# Altium project UsMimoTestBench_MainBoard.PrjPcb (part 1 of 2)
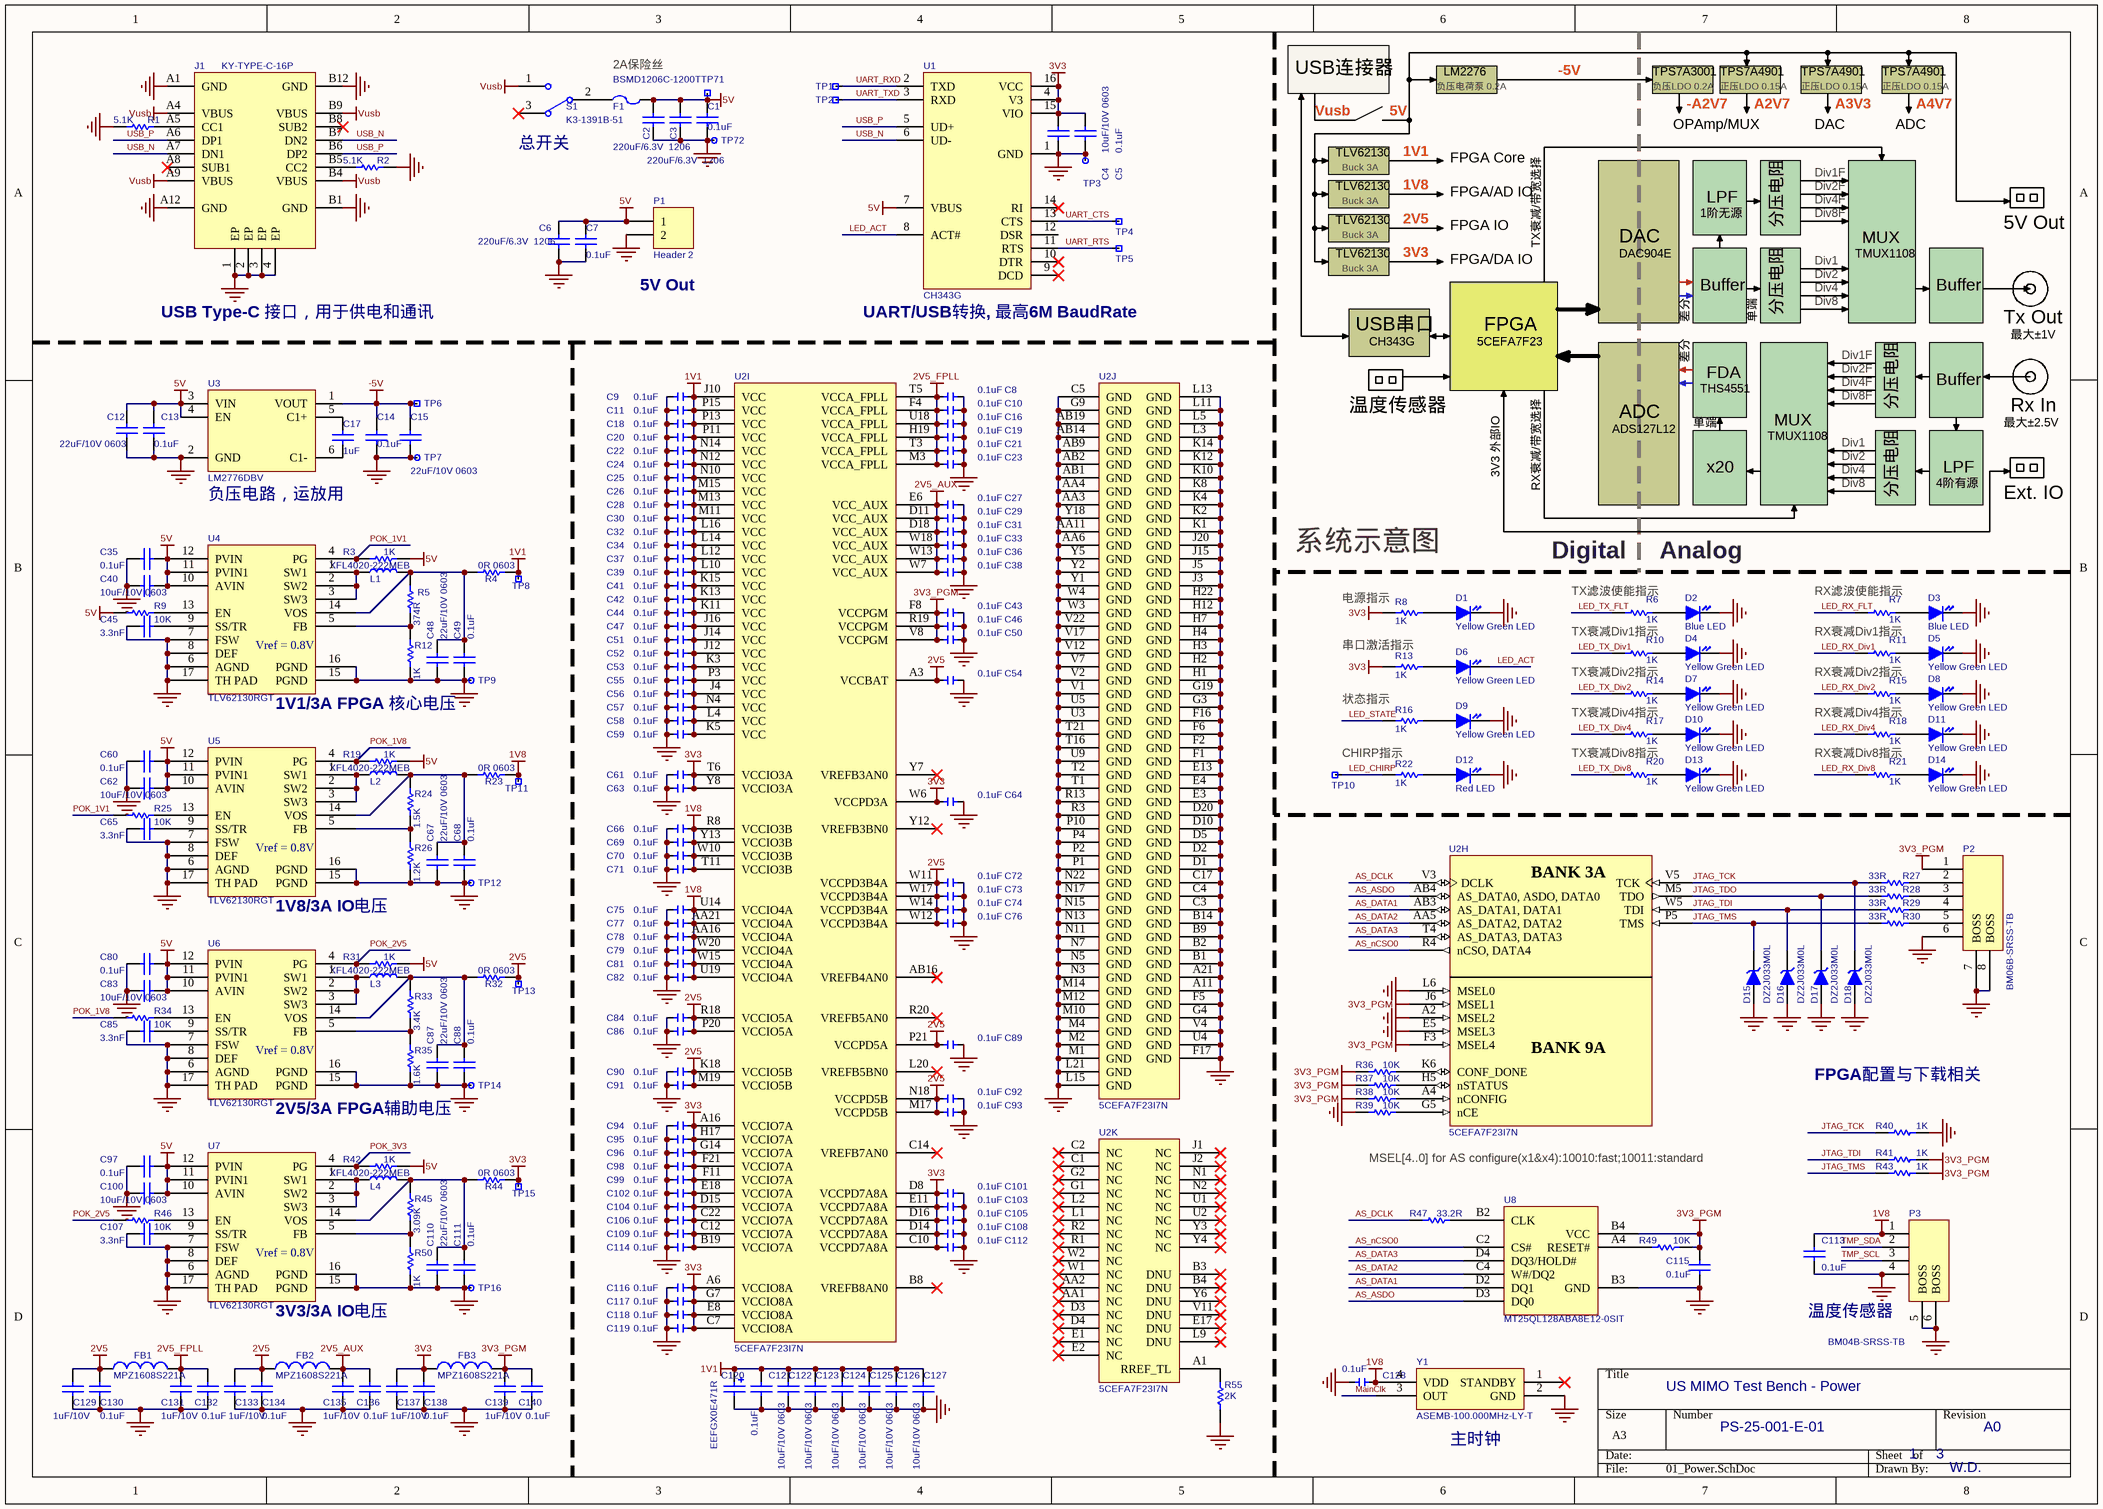
[diagram p0: 01_Power.SchDoc]
3 sheets, 526 parts. Net scope: global (net labels, ports and power ports of the same name join across sheets).
Board file: PS-25-001-E-01.PcbDoc
Sheets:
  01_Power.SchDoc
  02_Analog.SchDoc
  03_IO.SchDoc

## Sheet 01_Power.SchDoc
size A3

### Parts
C1  0.1uF  [1005[0402]CAP]
C2  220uF/6.3V  1206  [1206CAP]
C3  220uF/6.3V  1206  [1206CAP]
C4  10uF/10V 0603  [1608[0603]CAP]
C5  0.1uF  [1005[0402]CAP]
C6  220uF/6.3V  1206  [1206CAP]
C7  0.1uF  [1005[0402]CAP]
C8  0.1uF  [1005[0402]CAP]
C9  0.1uF  [1005[0402]CAP]
C10  0.1uF  [1005[0402]CAP]
C11  0.1uF  [1005[0402]CAP]
C12  22uF/10V 0603  [1608[0603]CAP]
C13  0.1uF  [1005[0402]CAP]
C14  0.1uF  [1005[0402]CAP]
C15  22uF/10V 0603  [1608[0603]CAP]
C16  0.1uF  [1005[0402]CAP]
C17  1uF  [1005[0402]CAP]
C18  0.1uF  [1005[0402]CAP]
C19  0.1uF  [1005[0402]CAP]
C20  0.1uF  [1005[0402]CAP]
C21  0.1uF  [1005[0402]CAP]
C22  0.1uF  [1005[0402]CAP]
C23  0.1uF  [1005[0402]CAP]
C24  0.1uF  [1005[0402]CAP]
C25  0.1uF  [1005[0402]CAP]
C26  0.1uF  [1005[0402]CAP]
C27  0.1uF  [1005[0402]CAP]
C28  0.1uF  [1005[0402]CAP]
C29  0.1uF  [1005[0402]CAP]
C30  0.1uF  [1005[0402]CAP]
C31  0.1uF  [1005[0402]CAP]
C32  0.1uF  [1005[0402]CAP]
C33  0.1uF  [1005[0402]CAP]
C34  0.1uF  [1005[0402]CAP]
C35  0.1uF  [1005[0402]CAP]
C36  0.1uF  [1005[0402]CAP]
C37  0.1uF  [1005[0402]CAP]
C38  0.1uF  [1005[0402]CAP]
C39  0.1uF  [1005[0402]CAP]
C40  10uF/10V 0603  [1608[0603]CAP]
C41  0.1uF  [1005[0402]CAP]
C42  0.1uF  [1005[0402]CAP]
C43  0.1uF  [1005[0402]CAP]
C44  0.1uF  [1005[0402]CAP]
C45  3.3nF  [1005[0402]CAP]
C46  0.1uF  [1005[0402]CAP]
C47  0.1uF  [1005[0402]CAP]
C48  22uF/10V 0603  [1608[0603]CAP]
C49  0.1uF  [1005[0402]CAP]
C50  0.1uF  [1005[0402]CAP]
C51  0.1uF  [1005[0402]CAP]
C52  0.1uF  [1005[0402]CAP]
C53  0.1uF  [1005[0402]CAP]
C54  0.1uF  [1005[0402]CAP]
C55  0.1uF  [1005[0402]CAP]
C56  0.1uF  [1005[0402]CAP]
C57  0.1uF  [1005[0402]CAP]
C58  0.1uF  [1005[0402]CAP]
C59  0.1uF  [1005[0402]CAP]
C60  0.1uF  [1005[0402]CAP]
C61  0.1uF  [1005[0402]CAP]
C62  10uF/10V 0603  [1608[0603]CAP]
C63  0.1uF  [1005[0402]CAP]
C64  0.1uF  [1005[0402]CAP]
C65  3.3nF  [1005[0402]CAP]
C66  0.1uF  [1005[0402]CAP]
C67  22uF/10V 0603  [1608[0603]CAP]
C68  0.1uF  [1005[0402]CAP]
C69  0.1uF  [1005[0402]CAP]
C70  0.1uF  [1005[0402]CAP]
C71  0.1uF  [1005[0402]CAP]
C72  0.1uF  [1005[0402]CAP]
C73  0.1uF  [1005[0402]CAP]
C74  0.1uF  [1005[0402]CAP]
C75  0.1uF  [1005[0402]CAP]
C76  0.1uF  [1005[0402]CAP]
C77  0.1uF  [1005[0402]CAP]
C78  0.1uF  [1005[0402]CAP]
C79  0.1uF  [1005[0402]CAP]
C80  0.1uF  [1005[0402]CAP]
C81  0.1uF  [1005[0402]CAP]
C82  0.1uF  [1005[0402]CAP]
C83  10uF/10V 0603  [1608[0603]CAP]
C84  0.1uF  [1005[0402]CAP]
C85  3.3nF  [1005[0402]CAP]
C86  0.1uF  [1005[0402]CAP]
C87  22uF/10V 0603  [1608[0603]CAP]
C88  0.1uF  [1005[0402]CAP]
C89  0.1uF  [1005[0402]CAP]
C90  0.1uF  [1005[0402]CAP]
C91  0.1uF  [1005[0402]CAP]
C92  0.1uF  [1005[0402]CAP]
C93  0.1uF  [1005[0402]CAP]
C94  0.1uF  [1005[0402]CAP]
C95  0.1uF  [1005[0402]CAP]
C96  0.1uF  [1005[0402]CAP]
C97  0.1uF  [1005[0402]CAP]
C98  0.1uF  [1005[0402]CAP]
C99  0.1uF  [1005[0402]CAP]
C100  10uF/10V 0603  [1608[0603]CAP]
C101  0.1uF  [1005[0402]CAP]
C102  0.1uF  [1005[0402]CAP]
C103  0.1uF  [1005[0402]CAP]
C104  0.1uF  [1005[0402]CAP]
C105  0.1uF  [1005[0402]CAP]
C106  0.1uF  [1005[0402]CAP]
C107  3.3nF  [1005[0402]CAP]
C108  0.1uF  [1005[0402]CAP]
C109  0.1uF  [1005[0402]CAP]
C110  22uF/10V 0603  [1608[0603]CAP]
C111  0.1uF  [1005[0402]CAP]
C112  0.1uF  [1005[0402]CAP]
C113  0.1uF  [1005[0402]CAP]
C114  0.1uF  [1005[0402]CAP]
C115  0.1uF  [1005[0402]CAP]
C116  0.1uF  [1005[0402]CAP]
C117  0.1uF  [1005[0402]CAP]
C118  0.1uF  [1005[0402]CAP]
C119  0.1uF  [1005[0402]CAP]
C120  EEFGX0E471R  [TE]
C121  0.1uF  [1005[0402]CAP]
C122  10uF/10V 0603  [1608[0603]CAP]
C123  10uF/10V 0603  [1608[0603]CAP]
C124  10uF/10V 0603  [1608[0603]CAP]
C125  10uF/10V 0603  [1608[0603]CAP]
C126  10uF/10V 0603  [1608[0603]CAP]
C127  10uF/10V 0603  [1608[0603]CAP]
C128  0.1uF  [1005[0402]CAP]
C129  1uF/10V  [1005[0402]CAP]
C130  0.1uF  [1005[0402]CAP]
C131  1uF/10V  [1005[0402]CAP]
C132  0.1uF  [1005[0402]CAP]
C133  1uF/10V  [1005[0402]CAP]
C134  0.1uF  [1005[0402]CAP]
C135  1uF/10V  [1005[0402]CAP]
C136  0.1uF  [1005[0402]CAP]
C137  1uF/10V  [1005[0402]CAP]
C138  0.1uF  [1005[0402]CAP]
C139  1uF/10V  [1005[0402]CAP]
C140  0.1uF  [1005[0402]CAP]
D1  Yellow Green LED  [1608[0603]LED]
D2  Blue LED  [1608[0603]LED]
D3  Blue LED  [1608[0603]LED]
D4  Yellow Green LED  [1608[0603]LED]
D5  Yellow Green LED  [1608[0603]LED]
D6  Yellow Green LED  [1608[0603]LED]
D7  Yellow Green LED  [1608[0603]LED]
D8  Yellow Green LED  [1608[0603]LED]
D9  Yellow Green LED  [1608[0603]LED]
D10  Yellow Green LED  [1608[0603]LED]
D11  Yellow Green LED  [1608[0603]LED]
D12  Red LED  [1608[0603]LED]
D13  Yellow Green LED  [1608[0603]LED]
D14  Yellow Green LED  [1608[0603]LED]
D15  DZ2J033M0L  [SC-90A]
D16  DZ2J033M0L  [SC-90A]
D17  DZ2J033M0L  [SC-90A]
D18  DZ2J033M0L  [SC-90A]
F1  BSMD1206C-1200T  [1206]
FB1  MPZ1608S221A  [1608[0603]FB]
FB2  MPZ1608S221A  [1608[0603]FB]
FB3  MPZ1608S221A  [1608[0603]FB]
J1  KY-TYPE-C-16P  [USBTypeC]
L1  XFL4020-222MEB  [XFL4020]
L2  XFL4020-222MEB  [XFL4020]
L3  XFL4020-222MEB  [XFL4020]
L4  XFL4020-222MEB  [XFL4020]
P1  Header 2  [KEF2510_2P]
P2  BM06B-SRSS-TB  [SM06B-SRSS-TB]
P3  BM04B-SRSS-TB  [BM04B-SRSS-TB]
R1  5.1K  [1005[0402]RES]
R2  5.1K  [1005[0402]RES]
R3  1K  [1005[0402]RES]
R4  0R 0603  [1608[0603]RES]
R5  374R  [1005[0402]RES]
R6  1K  [1005[0402]RES]
R7  1K  [1005[0402]RES]
R8  1K  [1005[0402]RES]
R9  10K  [1005[0402]RES]
R10  1K  [1005[0402]RES]
R11  1K  [1005[0402]RES]
R12  1K  [1005[0402]RES]
R13  1K  [1005[0402]RES]
R14  1K  [1005[0402]RES]
R15  1K  [1005[0402]RES]
R16  1K  [1005[0402]RES]
R17  1K  [1005[0402]RES]
R18  1K  [1005[0402]RES]
R19  1K  [1005[0402]RES]
R20  1K  [1005[0402]RES]
R21  1K  [1005[0402]RES]
R22  1K  [1005[0402]RES]
R23  0R 0603  [1608[0603]RES]
R24  1.5K  [1005[0402]RES]
R25  10K  [1005[0402]RES]
R26  1.2K  [1005[0402]RES]
R27  33R  [1005[0402]RES]
R28  33R  [1005[0402]RES]
R29  33R  [1005[0402]RES]
R30  33R  [1005[0402]RES]
R31  1K  [1005[0402]RES]
R32  0R 0603  [1608[0603]RES]
R33  3.4K  [1005[0402]RES]
R34  10K  [1005[0402]RES]
R35  1.6K  [1005[0402]RES]
R36  10K  [1005[0402]RES]
R37  10K  [1005[0402]RES]
R38  10K  [1005[0402]RES]
R39  10K  [1005[0402]RES]
R40  1K  [1005[0402]RES]
R41  1K  [1005[0402]RES]
R42  1K  [1005[0402]RES]
R43  1K  [1005[0402]RES]
R44  0R 0603  [1608[0603]RES]
R45  3.09K  [1005[0402]RES]
R46  10K  [1005[0402]RES]
R47  33.2R  [1005[0402]RES]
R49  10K  [1005[0402]RES]
R50  1K  [1005[0402]RES]
R55  2K  [1005[0402]RES]
S1  K3-1391B-51  [SWITCH_K3-1391B-51]
TP1  TP_P  [tpad_020_REC]  (value not drawn)
TP2  TP_P  [tpad_020_REC]  (value not drawn)
TP3  TP_N  [tpad_020]  (value not drawn)
TP4  TP_P  [tpad_020_REC]  (value not drawn)
TP5  TP_P  [tpad_020_REC]  (value not drawn)
TP6  TP_P  [tpad_020_REC]  (value not drawn)
TP7  TP_N  [tpad_020]  (value not drawn)
TP8  TP_P  [tpad_020_REC]  (value not drawn)
TP9  TP_N  [tpad_020]  (value not drawn)
TP10  TP_P  [tpad_020_REC]  (value not drawn)
TP11  TP_P  [tpad_020_REC]  (value not drawn)
TP12  TP_N  [tpad_020]  (value not drawn)
TP13  TP_P  [tpad_020_REC]  (value not drawn)
TP14  TP_N  [tpad_020]  (value not drawn)
TP15  TP_P  [tpad_020_REC]  (value not drawn)
TP16  TP_N  [tpad_020]  (value not drawn)
TP71  TP_P  [tpad_020_REC]  (value not drawn)
TP72  TP_N  [tpad_020]  (value not drawn)
U1  CH343G  [SO-16]
U2  5CEFA7F23I7N  [FBGA484]  (parts H,I,J,K of 11)
U3  LM2776DBV  [SOT23-6]
U4  TLV62130RGT  [S-PVQFN-N16]
U5  TLV62130RGT  [S-PVQFN-N16]
U6  TLV62130RGT  [S-PVQFN-N16]
U7  TLV62130RGT  [S-PVQFN-N16]
U8  MT25QL128ABA8E12-0SIT  [T-PBGA_5X5]
Y1  ASEMB-100.000MHz-LY-T  [XTAL_3.2X2.5]

### Nets
1V1: C9.2 C11.2 C18.2 C20.2 C22.2 C24.2 C25.2 C26.2 C28.2 C30.2 C32.2 C34.2 C37.2 C39.2 C41.2 C42.2 C44.2 C47.2 C51.2 C52.2 C53.2 C55.2 C56.2 C57.2 C58.2 C59.2 C120.1 C121.2 C122.1 C123.1 C124.1 C125.1 C126.1 C127.1 R4.1 TP8.1(A2) U2.J4(VCC) U2.J10(VCC) U2.J12(VCC) U2.J14(VCC) U2.J16(VCC) U2.K3(VCC) U2.K5(VCC) U2.K11(VCC) U2.K13(VCC) U2.K15(VCC) U2.L4(VCC) U2.L10(VCC) U2.L12(VCC) U2.L14(VCC) U2.L16(VCC) U2.M11(VCC) U2.M13(VCC) U2.M15(VCC) U2.N4(VCC) U2.N10(VCC) U2.N12(VCC) U2.N14(VCC) U2.P3(VCC) U2.P11(VCC) U2.P13(VCC) U2.P15(VCC)
1V8: C66.2 C69.2 C70.2 C71.2 C75.2 C77.2 C78.2 C79.2 C81.2 C82.2 C113.2 C128.1 P3.1 R23.1 TP11.1(A2) U2.AA16(VCCIO4A) U2.AA21(VCCIO4A) U2.R8(VCCIO3B) U2.T11(VCCIO3B) U2.U14(VCCIO4A) U2.U19(VCCIO4A) U2.W10(VCCIO3B) U2.W15(VCCIO4A) U2.W20(VCCIO4A) U2.Y13(VCCIO3B) Y1.4(VDD)
2V5: C54.2 C72.2 C73.2 C74.2 C76.2 C84.2 C86.2 C89.2 C90.2 C91.2 C92.2 C93.2 C129.1 C130.2 C133.1 C134.2 FB1.1 FB2.1 R32.1 TP13.1(A2) U2.A3(VCCBAT) U2.K18(VCCIO5B) U2.M17(VCCPD5B) U2.M19(VCCIO5B) U2.N18(VCCPD5B) U2.P20(VCCIO5A) U2.P21(VCCPD5A) U2.R18(VCCIO5A) U2.W11(VCCPD3B4A) U2.W12(VCCPD3B4A) U2.W14(VCCPD3B4A) U2.W17(VCCPD3B4A)
2V5_AUX: C27.2 C29.2 C31.2 C33.2 C36.2 C38.2 C135.1 C136.2 FB2.2 U2.D11(VCC_AUX) U2.D18(VCC_AUX) U2.E6(VCC_AUX) U2.W7(VCC_AUX) U2.W13(VCC_AUX) U2.W18(VCC_AUX)
2V5_FPLL: C8.2 C10.2 C16.2 C19.2 C21.2 C23.2 C131.1 C132.2 FB1.2 U2.F4(VCCA_FPLL) U2.H19(VCCA_FPLL) U2.M3(VCCA_FPLL) U2.T3(VCCA_FPLL) U2.T5(VCCA_FPLL) U2.U18(VCCA_FPLL)
3V3: C4.1 C5.2 C61.2 C63.2 C64.2 C94.2 C95.2 C96.2 C98.2 C99.2 C101.2 C102.2 C103.2 C104.2 C105.2 C106.2 C108.2 C109.2 C112.2 C114.2 C116.2 C117.2 C118.2 C119.2 C137.1 C138.2 FB3.1 R8.2 R13.2 R44.1 TP15.1(A2) U1.4(V3) U1.15(VIO) U1.16(VCC) U2.A6(VCCIO8A) U2.A16(VCCIO7A) U2.B19(VCCIO7A) U2.C7(VCCIO8A) U2.C10(VCCPD7A8A) U2.C12(VCCIO7A) U2.C22(VCCIO7A) U2.D8(VCCPD7A8A) U2.D14(VCCPD7A8A) U2.D15(VCCIO7A) U2.D16(VCCPD7A8A) U2.E8(VCCIO8A) U2.E11(VCCPD7A8A) U2.E18(VCCIO7A) U2.F11(VCCIO7A) U2.F21(VCCIO7A) U2.G7(VCCIO8A) U2.G14(VCCIO7A) U2.H17(VCCIO7A) U2.T6(VCCIO3A) U2.W6(VCCPD3A) U2.Y8(VCCIO3A)
3V3_PGM: C43.2 C46.2 C50.2 C115.2 C139.1 C140.2 FB3.2 P2.1 R36.2 R37.2 R38.2 R41.2 R43.2 R49.1 U2.F3(MSEL4) U2.F8(VCCPGM) U2.J6(MSEL1) U2.R19(VCCPGM) U2.V8(VCCPGM) U8.B4(VCC)
5V: C1.2 C2.2 C3.2 C6.2 C7.2 C12.1 C13.2 C35.1 C40.1 C60.1 C62.1 C80.1 C83.1 C97.1 C100.1 F1.2 P1.1 R3.1 R9.1 R19.1 R31.1 R42.1 TP71.1(A2) U1.7(VBUS) U3.3(VIN) U3.4(EN) U4.10(AVIN) U4.11(PVIN1) U4.12(PVIN) U5.10(AVIN) U5.11(PVIN1) U5.12(PVIN) U6.10(AVIN) U6.11(PVIN1) U6.12(PVIN) U7.10(AVIN) U7.11(PVIN1) U7.12(PVIN)
-5V: C14.2 C15.1 TP6.1(A2) U3.1(VOUT)
GND: C1.1 C2.1 C3.1 C4.2 C5.1 C6.1 C7.1 C8.1 C9.1 C10.1 C11.1 C12.2 C13.1 C14.1 C15.2 C16.1 C18.1 C19.1 C20.1 C21.1 C22.1 C23.1 C24.1 C25.1 C26.1 C27.1 C28.1 C29.1 C30.1 C31.1 C32.1 C33.1 C34.1 C35.2 C36.1 C37.1 C38.1 C39.1 C40.2 C41.1 C42.1 C43.1 C44.1 C45.2 C46.1 C47.1 C48.2 C49.1 C50.1 C51.1 C52.1 C53.1 C54.1 C55.1 C56.1 C57.1 C58.1 C59.1 C60.2 C61.1 C62.2 C63.1 C64.1 C65.2 C66.1 C67.2 C68.1 C69.1 C70.1 C71.1 C72.1 C73.1 C74.1 C75.1 C76.1 C77.1 C78.1 C79.1 C80.2 C81.1 C82.1 C83.2 C84.1 C85.2 C86.1 C87.2 C88.1 C89.1 C90.1 C91.1 C92.1 C93.1 C94.1 C95.1 C96.1 C97.2 C98.1 C99.1 C100.2 C101.1 C102.1 C103.1 C104.1 C105.1 C106.1 C107.2 C108.1 C109.1 C110.2 C111.1 C112.1 C113.1 C114.1 C115.1 C116.1 C117.1 C118.1 C119.1 C120.2 C121.1 C122.2 C123.2 C124.2 C125.2 C126.2 C127.2 C128.2 C129.2 C130.1 C131.2 C132.1 C133.2 C134.1 C135.2 C136.1 C137.2 C138.1 C139.2 C140.1 D1.2(K) D2.2(K) D3.2(K) D4.2(K) D5.2(K) D7.2(K) D8.2(K) D9.2(K) D10.2(K) D11.2(K) D12.2(K) D13.2(K) D14.2(K) D15.1(A) D16.1(A) D17.1(A) D18.1(A) J1.1(EP) J1.2(EP) J1.3(EP) J1.4(EP) J1.A1(GND) J1.A12(GND) J1.B1(GND) J1.B12(GND) P1.2 P2.6 P2.7(BOSS) P2.8(BOSS) P3.4 P3.5(BOSS) P3.6(BOSS) R1.2 R2.1 R12.1 R26.1 R35.1 R39.2 R40.2 R50.1 R55.1 TP3.1(A2) TP7.1(A2) TP9.1(A2) TP12.1(A2) TP14.1(A2) TP16.1(A2) TP72.1(A2) U1.1(GND) U2.A2(MSEL2) U2.A11(GND) U2.A21(GND) U2.AA3(GND) U2.AA4(GND) U2.AA6(GND) U2.AA11(GND) U2.AB1(GND) U2.AB2(GND) U2.AB9(GND) U2.AB14(GND) U2.AB19(GND) U2.B1(GND) U2.B2(GND) U2.B9(GND) U2.B14(GND) U2.C3(GND) U2.C4(GND) U2.C5(GND) U2.C17(GND) U2.D1(GND) U2.D2(GND) U2.D5(GND) U2.D10(GND) U2.D20(GND) U2.E3(GND) U2.E4(GND) U2.E5(MSEL3) U2.E13(GND) U2.F1(GND) U2.F2(GND) U2.F5(GND) U2.F6(GND) U2.F16(GND) U2.F17(GND) U2.G3(GND) U2.G4(GND) U2.G9(GND) U2.G19(GND) U2.H1(GND) U2.H2(GND) U2.H3(GND) U2.H4(GND) U2.H7(GND) U2.H12(GND) U2.H22(GND) U2.J3(GND) U2.J5(GND) U2.J15(GND) U2.J20(GND) U2.K1(GND) U2.K2(GND) U2.K4(GND) U2.K8(GND) U2.K10(GND) U2.K12(GND) U2.K14(GND) U2.L3(GND) U2.L5(GND) U2.L6(MSEL0) U2.L11(GND) U2.L13(GND) U2.L15(GND) U2.L21(GND) U2.M1(GND) U2.M2(GND) U2.M4(GND) U2.M10(GND) U2.M12(GND) U2.M14(GND) U2.N3(GND) U2.N5(GND) U2.N7(GND) U2.N11(GND) U2.N13(GND) U2.N15(GND) U2.N17(GND) U2.N22(GND) U2.P1(GND) U2.P2(GND) U2.P4(GND) U2.P10(GND) U2.R3(GND) U2.R13(GND) U2.T1(GND) U2.T2(GND) U2.T16(GND) U2.T21(GND) U2.U3(GND) U2.U4(GND) U2.U5(GND) U2.U9(GND) U2.V1(GND) U2.V2(GND) U2.V4(GND) U2.V7(GND) U2.V12(GND) U2.V17(GND) U2.V22(GND) U2.W3(GND) U2.W4(GND) U2.Y1(GND) U2.Y2(GND) U2.Y5(GND) U2.Y18(GND) U3.2(GND) U4.6(AGND) U4.7(FSW) U4.8(DEF) U4.15(PGND) U4.16(PGND) U4.17(TH_PAD) U5.6(AGND) U5.7(FSW) U5.8(DEF) U5.15(PGND) U5.16(PGND) U5.17(TH_PAD) U6.6(AGND) U6.7(FSW) U6.8(DEF) U6.15(PGND) U6.16(PGND) U6.17(TH_PAD) U7.6(AGND) U7.7(FSW) U7.8(DEF) U7.15(PGND) U7.16(PGND) U7.17(TH_PAD) U8.B3(GND) Y1.2(GND)
Vusb: J1.A4(VBUS) J1.A9(VBUS) J1.B4(VBUS) J1.B9(VBUS) S1.1
AS_ASDO: U2.AB4(AS_DATA0,_ASDO,_DATA0) U8.D3(DQ0)
AS_DATA1: U2.AB3(AS_DATA1,_DATA1) U8.D2(DQ1)
AS_DATA2: U2.AA5(AS_DATA2,_DATA2) U8.C4(W#/DQ2)
AS_DATA3: U2.T4(AS_DATA3,_DATA3) U8.D4(DQ3/HOLD#)
AS_DCLK: R47.1 U2.V3(DCLK)
AS_nCSO0: U2.R4(nCSO,_DATA4) U8.C2(CS#)
JTAG_TCK: D18.2(K) R27.2 R40.1 U2.V5(TCK)
JTAG_TDI: D16.2(K) R29.2 R41.1 U2.W5(TDI)
JTAG_TDO: D17.2(K) R28.2 U2.M5(TDO)
JTAG_TMS: D15.2(K) R30.2 R43.1 U2.P5(TMS)
LED_ACT: D6.2(K) U1.8(ACT#)
LED_CHIRP: R22.2 TP10.1(A2)
LED_RX_Div1: R11.2
LED_RX_Div2: R15.2
LED_RX_Div4: R18.2
LED_RX_Div8: R21.2
LED_RX_FLT: R7.2
LED_STATE: R16.2
LED_TX_Div1: R10.2
LED_TX_Div2: R14.2
LED_TX_Div4: R17.2
LED_TX_Div8: R20.2
LED_TX_FLT: R6.2
MainClk: Y1.3(OUT)
POK_1V1: R3.2 R25.1 U4.4(PG)
POK_1V8: R19.2 R34.1 U5.4(PG)
POK_2V5: R31.2 R46.1 U6.4(PG)
POK_3V3: R42.2 U7.4(PG)
TMP_SCL: P3.3
TMP_SDA: P3.2
UART_CTS: TP4.1(A2) U1.13(CTS)
UART_RTS: TP5.1(A2) U1.11(RTS)
UART_RXD: TP1.1(A2) U1.2(TXD)
UART_TXD: TP2.1(A2) U1.3(RXD)
USB_N: J1.A7(DN1) J1.B7(DN2) U1.6(UD-)
USB_P: J1.A6(DP1) J1.B6(DP2) U1.5(UD+)
NetC17_1: C17.1 U3.6(C1-)
NetC17_2: C17.2 U3.5(C1+)
NetC45_1: C45.1 U4.9(SS/TR)
NetC48_1: C48.1 C49.2 L1.2 R4.2 R5.2 U4.14(VOS)
NetC65_1: C65.1 U5.9(SS/TR)
NetC67_1: C67.1 C68.2 L2.2 R23.2 R24.2 U5.14(VOS)
NetC85_1: C85.1 U6.9(SS/TR)
NetC87_1: C87.1 C88.2 L3.2 R32.2 R33.2 U6.14(VOS)
NetC107_1: C107.1 U7.9(SS/TR)
NetC110_1: C110.1 C111.2 L4.2 R44.2 R45.2 U7.14(VOS)
NetD1_1: D1.1(A) R8.1
NetD2_1: D2.1(A) R6.1
NetD3_1: D3.1(A) R7.1
NetD4_1: D4.1(A) R10.1
NetD5_1: D5.1(A) R11.1
NetD6_1: D6.1(A) R13.1
NetD7_1: D7.1(A) R14.1
NetD8_1: D8.1(A) R15.1
NetD9_1: D9.1(A) R16.1
NetD10_1: D10.1(A) R17.1
NetD11_1: D11.1(A) R18.1
NetD12_1: D12.1(A) R22.1
NetD13_1: D13.1(A) R20.1
NetD14_1: D14.1(A) R21.1
NetF1_1: F1.1 S1.2
NetJ1_A5: J1.A5(CC1) R1.1
NetJ1_B5: J1.B5(CC2) R2.2
NetL1_1: L1.1 U4.1(SW1) U4.2(SW2) U4.3(SW3)
NetL2_1: L2.1 U5.1(SW1) U5.2(SW2) U5.3(SW3)
NetL3_1: L3.1 U6.1(SW1) U6.2(SW2) U6.3(SW3)
NetL4_1: L4.1 U7.1(SW1) U7.2(SW2) U7.3(SW3)
NetP2_2: P2.2 R27.1
NetP2_3: P2.3 R28.1
NetP2_4: P2.4 R29.1
NetP2_5: P2.5 R30.1
NetR5_1: R5.1 R12.2 U4.5(FB)
NetR9_2: R9.2 U4.13(EN)
NetR24_1: R24.1 R26.2 U5.5(FB)
NetR25_2: R25.2 U5.13(EN)
NetR33_1: R33.1 R35.2 U6.5(FB)
NetR34_2: R34.2 U6.13(EN)
NetR36_1: R36.1 U2.K6(CONF_DONE)
NetR37_1: R37.1 U2.H5(nSTATUS)
NetR38_1: R38.1 U2.A4(nCONFIG)
NetR39_1: R39.1 U2.G5(nCE)
NetR45_1: R45.1 R50.2 U7.5(FB)
NetR46_2: R46.2 U7.13(EN)
NetR47_2: R47.2 U8.B2(CLK)
NetR49_2: R49.2 U8.A4(RESET#)
NetR55_2: R55.2 U2.A1(RREF_TL)

Not connected (* = marked no-connect by the designer): J1 A8(SUB1)* B8(SUB2)*; S1 3*; U1 9(DCD)* 10(DTR)* 12(DSR) 14(RI)*; U2 AA1(NC)* AA2(NC)* AB16(VREFB4AN0)* B3(DNU)* B4(DNU)* B8(VREFB8AN0)* C1(NC)* C2(NC)* C14(VREFB7AN0)* D3(NC)* D4(NC)* E1(NC)* E2(NC)* E17(DNU)* G1(NC)* G2(NC)* J1(NC)* J2(NC)* L1(NC)* L2(NC)* L9(DNU)* L20(VREFB5BN0)* N1(NC)* N2(NC)* R1(NC)* R2(NC)* R20(VREFB5AN0)* U1(NC)* U2(NC)* V11(DNU)* W1(NC)* W2(NC)* Y3(NC)* Y4(NC)* Y6(DNU)* Y7(VREFB3AN0)* Y12(VREFB3BN0)*; Y1 1(STANDBY)*

### Notes on the sheet
- 2A保险丝
- USB连接器
- 负压电荷泵 0.2A
- LM2276
- -5V
- TPS7A3001
- 负压LDO 0.2A
- -A2V7
- TPS7A4901
- 正压LDO 0.15A
- A2V7
- A3V3
- A4V7
- (near S1) 总开关
- Vusb
- TLV62130
- Buck 3A
- 5V
- 1V1
- FPGA Core
- OPAmp/MUX
- Div1F
- DAC
- ADC
- 1V8
- 2V5
- FPGA/AD IO
- FPGA IO
- TX衰减/带宽选择
- 1阶无源
- LPF
- 分压电阻
- Div8F
- Div4F
- Div2F
- MUX
- 5V Out
- USB Type-C 接口，用于供电和通讯
- (near U1) UART/USB转换, 最高6M BaudRate
- 3V3
- FPGA/DA IO
- DAC904E
- 差分
- Buffer
- 单端
- Div8
- Div4
- Div2
- Div1
- TMUX1108
- USB串口
- CH343G
- 5CEFA7F23
- FPGA
- FDA
- Tx Out
- 最大±1V
- 温度传感器
- ADS127L12
- THS4551
- 最大±2.5V
- Rx In
- (near U3) 负压电路，运放用
- 3V3 外部IO
- RX衰减/带宽选择
- x20
- 4阶有源
- Ext. IO
- 系统示意图
- Digital
- Analog
- 串口激活指示
- (near R8) 电源指示
- (near R6) TX滤波使能指示
- TX衰减Div1指示
- (near R7) RX滤波使能指示
- RX衰减Div1指示
- (near U4) 1V1/3A FPGA 核心电压
- 状态指示
- TX衰减Div2指示
- TX衰减Div4指示
- RX衰减Div2指示
- RX衰减Div4指示
- CHIRP指示
- TX衰减Div8指示
- RX衰减Div8指示
- (near U5) 1V8/3A IO电压
- (near U6) 2V5/3A FPGA辅助电压
- FPGA配置与下载相关
- MSEL[4..0] for AS configure(x1&x4):10010:fast;10011:standard
- (near U7) 3V3/3A IO电压
- US MIMO Test Bench - Power
- (near Y1) 主时钟
- PS-25-001-E-01
- 1
- 3
- A0
- W.D.
- (in symbol 5CEFA7F23, part H) BANK 3A; BANK 9A
- (in symbol TLV62130RGT_S) Vref = 0.8V

### Library data of the parts
C1-C7 C12-C15 C17 C35 C40 C45 C48 C49 C60 C62 C65 C67 C68 C80 C83 C85 C87 C88 C97 C100 C107 C110 C111 C113 C115 C121-C127 C129-C140 = Cap: Capacitor; Published: 8-Jun-2000; LatestRevisionDate: 17-Jul-2002; LatestRevisionNote: Re-released for DXP Platform.; PackageReference: RAD-0.3; Publisher: Altium Limited; PackageDescription: Radial Cap, Thru-Hole; 2 Leads; 0.3 in Pin Spacing
C8-C11 C16 C18-C34 C36-C39 C41-C44 C46 C47 C50-C59 C61 C63 C64 C66 C69-C79 C81 C82 C84 C86 C89-C96 C98 C99 C101-C106 C108 C109 C112 C114 C116-C119 C128 = Cap_S: Capacitor; Published: 8-Jun-2000; LatestRevisionDate: 17-Jul-2002; LatestRevisionNote: Re-released for DXP Platform.; PackageReference: RAD-0.3; Publisher: Altium Limited; PackageDescription: Radial Cap, Thru-Hole; 2 Leads; 0.3 in Pin Spacing
C120 = Cap Pol2: Polarized Capacitor (Axial); Published: 8-Jun-2000; LatestRevisionDate: 17-Jul-2002; LatestRevisionNote: Re-released for DXP Platform.; PackageReference: POLAR0.8; Publisher: Altium Limited; PackageDescription: Polarized Capacitor; 2 Leads
D1-D14 = LED0_S: Typical INFRARED GaAs LED; Published: 8-Jun-2000; LatestRevisionDate: 08-Jul-2005; LatestRevisionNote: Mech Layer 1 removed.; PackageReference: LED-0; Publisher: Altium Limited; PackageDescription: LED; 2 Leads
D15-D18 = D Zener_S: Zener Diode; Published: 8-Jun-2000; LatestRevisionDate: 17-Jul-2002; LatestRevisionNote: Re-released for DXP Platform.; PackageReference: DIODE-0.7; Publisher: Altium Limited; PackageDescription: Diode, Thru-Hole; 2 Leads; 0.7 in Pin Spacing
F1 = Fuse 2_S: Fuse; Published: 8-Jun-2000; LatestRevisionDate: 17-Jul-2002; LatestRevisionNote: Re-released for DXP Platform.; PackageReference: PIN-W2/E2.8; Publisher: Altium Limited; PackageDescription: Thru-Hole; 2 Leads
FB1-FB3 = Inductor: Code_IEC: 1005; Published: 8-Jun-2000; LatestRevisionDate: 29-May-2009; LatestRevisionNote: IPC-7351 Footprint Added.; PackageReference: 0402-A; Publisher: Altium Limited; PackageDescription: Chip Inductor; Code_JEITA: 0402
J1 = USBTypeC
L1-L4 = Inductor_S: Inductor; Code_IEC: 1005; Published: 8-Jun-2000; LatestRevisionDate: 29-May-2009; LatestRevisionNote: IPC-7351 Footprint Added.; PackageReference: 0402-A; Publisher: Altium Limited; PackageDescription: Chip Inductor; Code_JEITA: 0402
P1 = Header 2: Header, 2-Pin; LatestRevisionDate: 17-Jul-2002; LatestRevisionNote: Re-released for DXP Platform.; Publisher: Altium Limited
P2 = 6PinConWith2Boss
P3 = CON_4P_BOSS
R1-R47 R49 R50 R55 = Res1: Resistor; Published: 8-Jun-2000; LatestRevisionDate: 17-Jul-2002; LatestRevisionNote: Re-released for DXP Platform.; PackageReference: AXIAL-0.3; Publisher: Altium Limited; PackageDescription: Axial Device, Thru-Hole; 2 Leads; 0.3 in Pin Spacing
S1 = SW-SPDT: SPDT Subminiature Toggle Switch, Right Angle Mounting, Vertical Actuation; Published: 24-Mar-1999; LatestRevisionDate: 17-Dec-2003; LatestRevisionNote: Schematic revised, PCB Footprint replaced.; DatasheetVersion: 05-Dec-2000; PackageReference: TL36WW15050; Publisher: Altium Limited; PackageDescription: Switch; 4 Leads; ComponentLink1Description: Manufacturer Link; ComponentLink1URL: http://www.apem.com
U2 = 5CEFA7F23: Cyclone V E Family FPGA, 1.07 to 1.13 V Supply, 240 I/O Pins, 7 PLLs, 484-Pin FBGA, Speed Grade 7, Commercial Grade, RoHS Compliant; Manufacturer: Altera; Device Group: 5CEFA7; GPIO: 240; Logic Elements (LE) (K): 149.5; Speed Grade: 7; DatasheetVersion: Rev. 3.4; PackageVersion: Rev. 1.0, 12/2011; PackageReference: FBGA484; PackageDescription: 484-Pin FineLine Ball-Grid Array (FBGA), Body 23 x 23 mm, Pitch 1.0 mm; Supplier 1: Digi-Key; Supplier Part Number 1: 5CEFA7F23I7N; Supplier 2: Mouser; Supplier Part Number 2: 989-5CEFA7F23; RoHS: RoHS Compliant; Subcategory: Cyclone V E; Voltage Supply: 1.07 to 1.13 V; NexusDeviceID: 5CEFA7F23I7N; Mounting Technology: Surface Mount; Code_JEDEC: MO-275-PPAA-2; PartNumber: 5CEFA7F23I7N; ComponentLink1Description: Manufacturer URL; ComponentLink1URL: http://www.altera.com; ComponentLink2Description: Datasheet; ComponentLink2URL: http://www.altera.com/literature/hb/cyclone-v/cv_51002.pdf; ComponentLink3Description: Package Specification; ComponentLink3URL: http://www.altera.com/devicepackaging/04R00436-01.pdf; ComponentLink4Description: Device Handbook URL; ComponentLink4URL: http://www.altera.com/literature/hb/cyclone-v/cyclone5_handbook.pdf; ComponentLink5Description: Device Pin-Out URL; ComponentLink5URL: http://www.altera.com/literature/dp/cyclone-v/5CEFA7.xls; ComponentLink6Description: Device Overview URL; ComponentLink6URL: http://www.altera.com/literature/hb/cyclone-v/cv_51001.pdf; ComponentLink7Description: Product URL; ComponentLink7URL: http://www.buyaltera.com/scripts/partsearch.dll?Detail&name=5CEFA7U19C7N-ND
U3 = LM2776
U4-U7 = TLV62130RGT_S
U8 = MT25QL128ABA8E12
Y1 = XTAL_ACTIVE

## Sheet 02_Analog.SchDoc
size A3
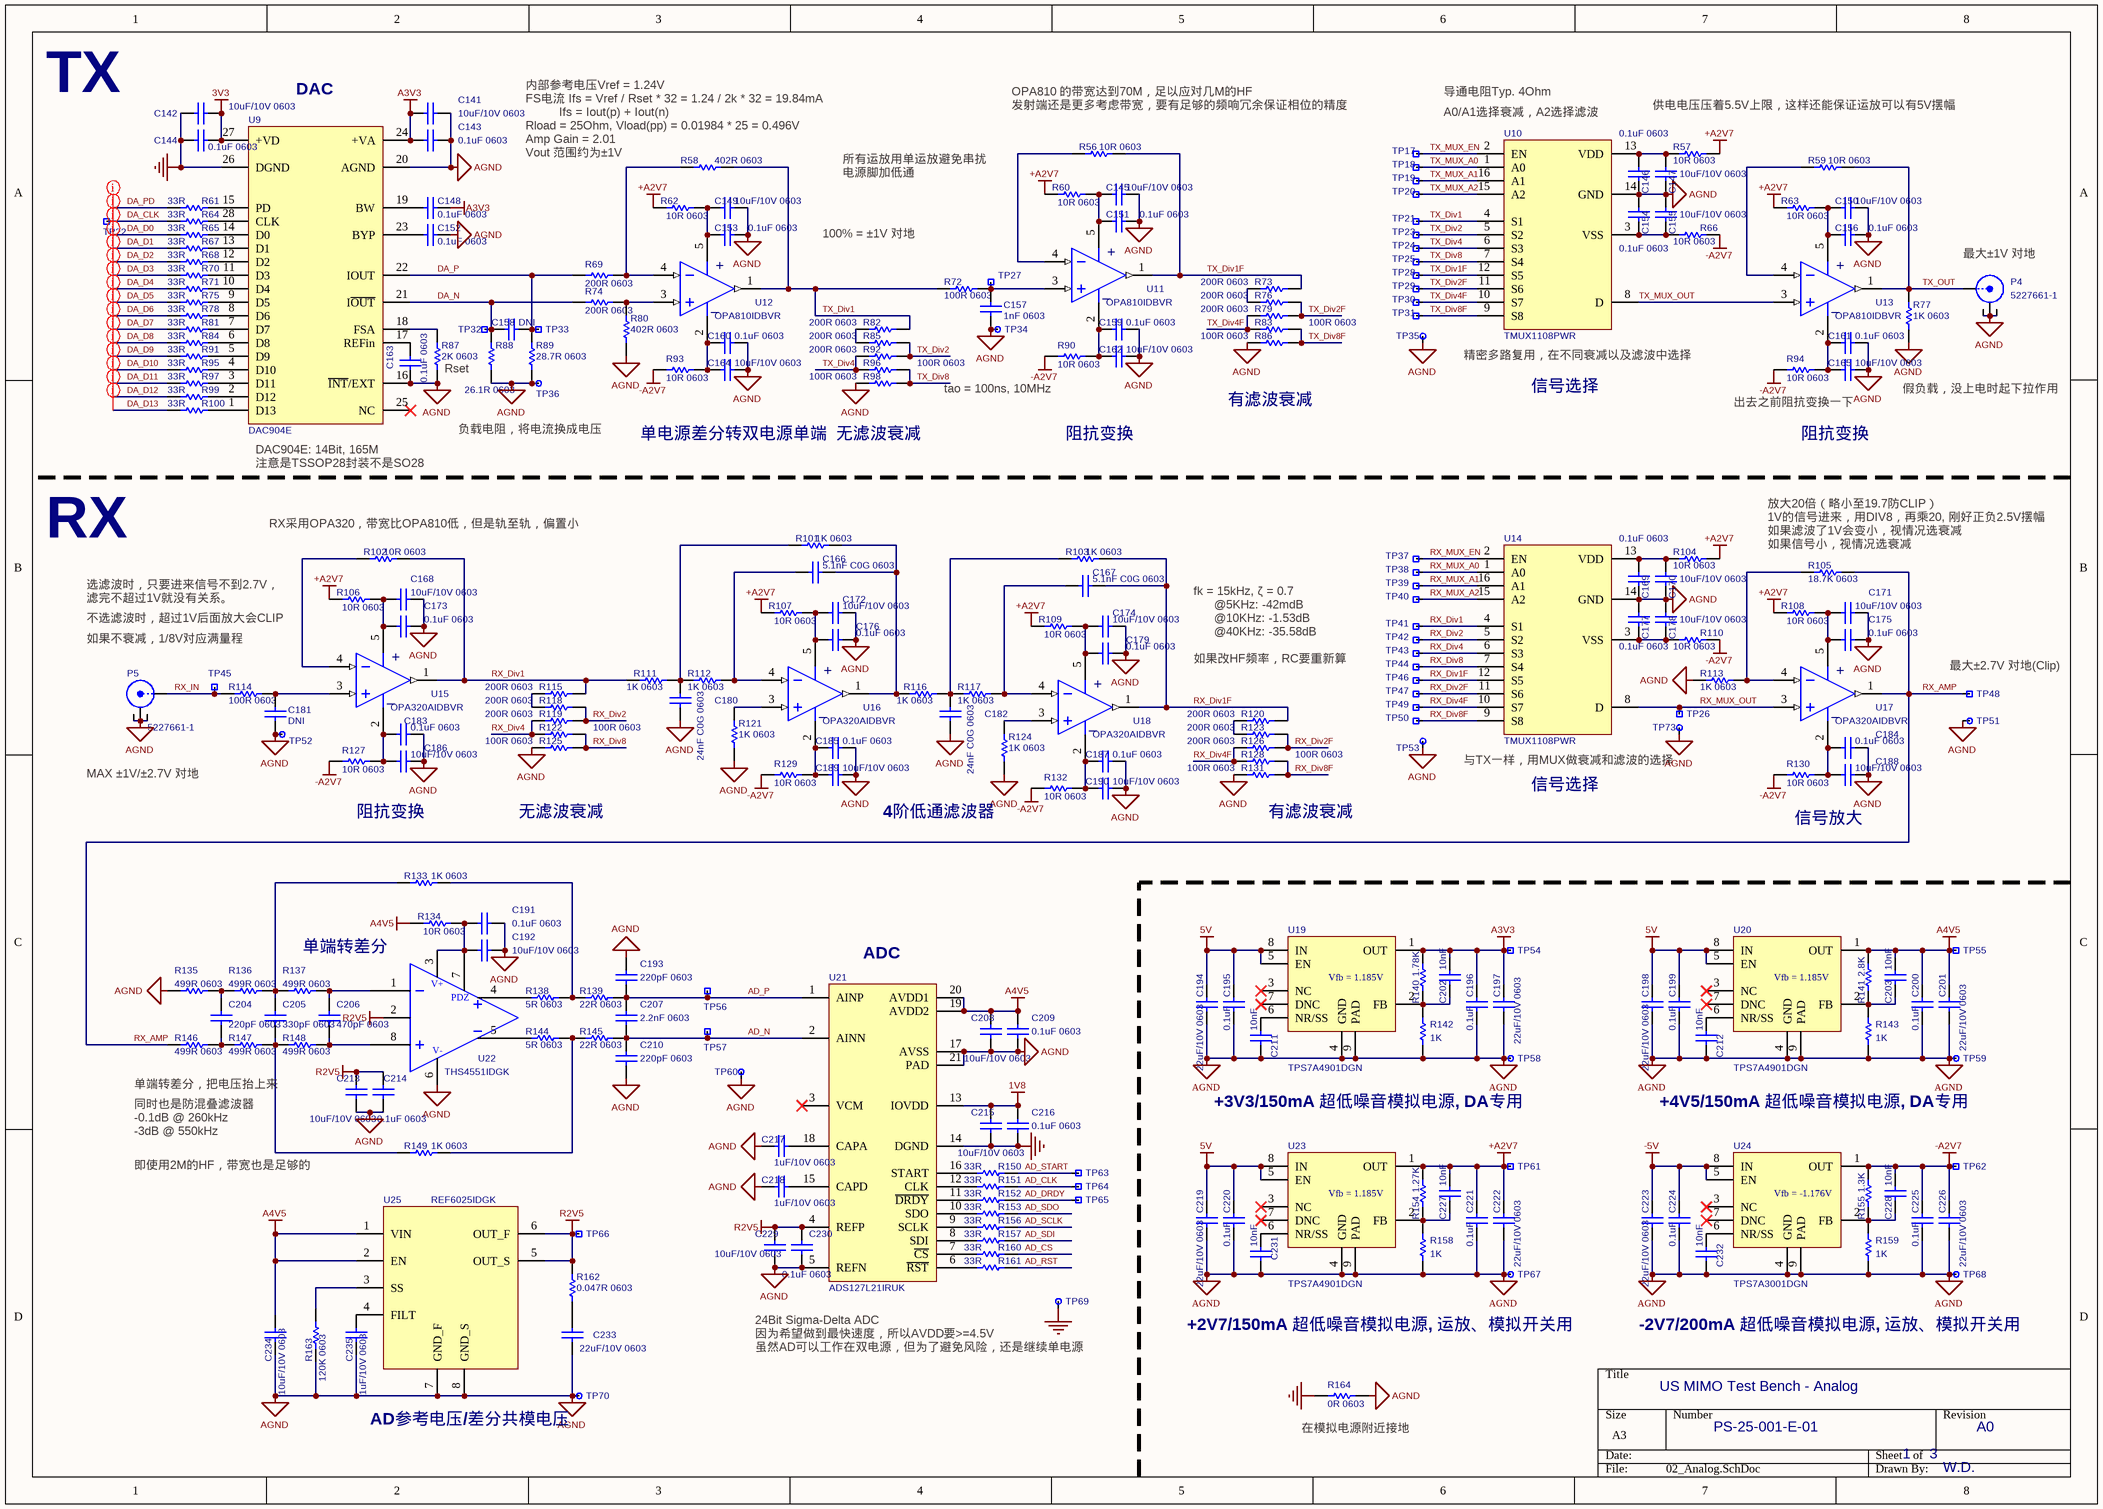
[diagram p1: 02_Analog.SchDoc]

### Parts
C141  10uF/10V 0603  [1608[0603]CAP]
C142  10uF/10V 0603  [1608[0603]CAP]
C143  0.1uF 0603  [1608[0603]CAP]
C144  0.1uF 0603  [1608[0603]CAP]
C145  10uF/10V 0603  [1608[0603]CAP]
C146  0.1uF 0603  [1608[0603]CAP]
C147  10uF/10V 0603  [1608[0603]CAP]
C148  0.1uF 0603  [1608[0603]CAP]
C149  10uF/10V 0603  [1608[0603]CAP]
C150  10uF/10V 0603  [1608[0603]CAP]
C151  0.1uF 0603  [1608[0603]CAP]
C152  0.1uF 0603  [1608[0603]CAP]
C153  0.1uF 0603  [1608[0603]CAP]
C154  0.1uF 0603  [1608[0603]CAP]
C155  10uF/10V 0603  [1608[0603]CAP]
C156  0.1uF 0603  [1608[0603]CAP]
C157  1nF 0603  [1608[0603]CAP]
C158  DNI  [1608[0603]CAP]
C159  0.1uF 0603  [1608[0603]CAP]
C160  0.1uF 0603  [1608[0603]CAP]
C161  0.1uF 0603  [1608[0603]CAP]
C162  10uF/10V 0603  [1608[0603]CAP]
C163  0.1uF 0603  [1608[0603]CAP]
C164  10uF/10V 0603  [1608[0603]CAP]
C165  10uF/10V 0603  [1608[0603]CAP]
C166  5.1nF C0G 0603  [1608[0603]CAP]
C167  5.1nF C0G 0603  [1608[0603]CAP]
C168  10uF/10V 0603  [1608[0603]CAP]
C169  0.1uF 0603  [1608[0603]CAP]
C170  10uF/10V 0603  [1608[0603]CAP]
C171  10uF/10V 0603  [1608[0603]CAP]
C172  10uF/10V 0603  [1608[0603]CAP]
C173  0.1uF 0603  [1608[0603]CAP]
C174  10uF/10V 0603  [1608[0603]CAP]
C175  0.1uF 0603  [1608[0603]CAP]
C176  0.1uF 0603  [1608[0603]CAP]
C177  0.1uF 0603  [1608[0603]CAP]
C178  10uF/10V 0603  [1608[0603]CAP]
C179  0.1uF 0603  [1608[0603]CAP]
C180  24nF C0G 0603  [1608[0603]CAP]
C181  DNI  [1608[0603]CAP]
C182  24nF C0G 0603  [1608[0603]CAP]
C183  0.1uF 0603  [1608[0603]CAP]
C184  0.1uF 0603  [1608[0603]CAP]
C185  0.1uF 0603  [1608[0603]CAP]
C186  10uF/10V 0603  [1608[0603]CAP]
C187  0.1uF 0603  [1608[0603]CAP]
C188  10uF/10V 0603  [1608[0603]CAP]
C189  10uF/10V 0603  [1608[0603]CAP]
C190  10uF/10V 0603  [1608[0603]CAP]
C191  0.1uF 0603  [1608[0603]CAP]
C192  10uF/10V 0603  [1608[0603]CAP]
C193  220pF 0603  [1608[0603]CAP]
C194  22uF/10V 0603  [1608[0603]CAP]
C195  0.1uF  [1005[0402]CAP]
C196  0.1uF  [1005[0402]CAP]
C197  22uF/10V 0603  [1608[0603]CAP]
C198  22uF/10V 0603  [1608[0603]CAP]
C199  0.1uF  [1005[0402]CAP]
C200  0.1uF  [1005[0402]CAP]
C201  22uF/10V 0603  [1608[0603]CAP]
C202  10nF  [1005[0402]CAP]
C203  10nF  [1005[0402]CAP]
C204  220pF 0603  [1608[0603]CAP]
C205  330pF 0603  [1608[0603]CAP]
C206  470pF 0603  [1608[0603]CAP]
C207  2.2nF 0603  [1608[0603]CAP]
C208  10uF/10V 0603  [1608[0603]CAP]
C209  0.1uF 0603  [1608[0603]CAP]
C210  220pF 0603  [1608[0603]CAP]
C211  10nF  [1005[0402]CAP]
C212  10nF  [1005[0402]CAP]
C213  10uF/10V 0603  [1608[0603]CAP]
C214  0.1uF 0603  [1608[0603]CAP]
C215  10uF/10V 0603  [1608[0603]CAP]
C216  0.1uF 0603  [1608[0603]CAP]
C217  1uF/10V 0603  [1608[0603]CAP]
C218  1uF/10V 0603  [1608[0603]CAP]
C219  22uF/10V 0603  [1608[0603]CAP]
C220  0.1uF  [1005[0402]CAP]
C221  0.1uF  [1005[0402]CAP]
C222  22uF/10V 0603  [1608[0603]CAP]
C223  22uF/10V 0603  [1608[0603]CAP]
C224  0.1uF  [1005[0402]CAP]
C225  0.1uF  [1005[0402]CAP]
C226  22uF/10V 0603  [1608[0603]CAP]
C227  10nF  [1005[0402]CAP]
C228  10nF  [1005[0402]CAP]
C229  10uF/10V 0603  [1608[0603]CAP]
C230  0.1uF 0603  [1608[0603]CAP]
C231  10nF  [1005[0402]CAP]
C232  10nF  [1005[0402]CAP]
C233  22uF/10V 0603  [1608[0603]CAP]
C234  10uF/10V 0603  [1608[0603]CAP]
C235  1uF/10V 0603  [1608[0603]CAP]
P4  5227661-1  [BNC_5227661-1]
P5  5227661-1  [BNC_5227661-1]
R56  10R 0603  [1608[0603]RES]
R57  10R 0603  [1608[0603]RES]
R58  402R 0603  [1608[0603]RES]
R59  10R 0603  [1608[0603]RES]
R60  10R 0603  [1608[0603]RES]
R61  33R  [1005[0402]RES]
R62  10R 0603  [1608[0603]RES]
R63  10R 0603  [1608[0603]RES]
R64  33R  [1005[0402]RES]
R65  33R  [1005[0402]RES]
R66  10R 0603  [1608[0603]RES]
R67  33R  [1005[0402]RES]
R68  33R  [1005[0402]RES]
R69  200R 0603  [1608[0603]RES]
R70  33R  [1005[0402]RES]
R71  33R  [1005[0402]RES]
R72  100R 0603  [1608[0603]RES]
R73  200R 0603  [1608[0603]RES]
R74  200R 0603  [1608[0603]RES]
R75  33R  [1005[0402]RES]
R76  200R 0603  [1608[0603]RES]
R77  1K 0603  [1608[0603]RES]
R78  33R  [1005[0402]RES]
R79  200R 0603  [1608[0603]RES]
R80  402R 0603  [1608[0603]RES]
R81  33R  [1005[0402]RES]
R82  200R 0603  [1608[0603]RES]
R83  100R 0603  [1608[0603]RES]
R84  33R  [1005[0402]RES]
R85  200R 0603  [1608[0603]RES]
R86  100R 0603  [1608[0603]RES]
R87  2K 0603  [1608[0603]RES]
R88  26.1R 0603  [1608[0603]RES]
R89  28.7R 0603  [1608[0603]RES]
R90  10R 0603  [1608[0603]RES]
R91  33R  [1005[0402]RES]
R92  200R 0603  [1608[0603]RES]
R93  10R 0603  [1608[0603]RES]
R94  10R 0603  [1608[0603]RES]
R95  33R  [1005[0402]RES]
R96  100R 0603  [1608[0603]RES]
R97  33R  [1005[0402]RES]
R98  100R 0603  [1608[0603]RES]
R99  33R  [1005[0402]RES]
R100  33R  [1005[0402]RES]
R101  1K 0603  [1608[0603]RES]
R102  10R 0603  [1608[0603]RES]
R103  1K 0603  [1608[0603]RES]
R104  10R 0603  [1608[0603]RES]
R105  18.7K 0603  [1608[0603]RES]
R106  10R 0603  [1608[0603]RES]
R107  10R 0603  [1608[0603]RES]
R108  10R 0603  [1608[0603]RES]
R109  10R 0603  [1608[0603]RES]
R110  10R 0603  [1608[0603]RES]
R111  1K 0603  [1608[0603]RES]
R112  1K 0603  [1608[0603]RES]
R113  1K 0603  [1608[0603]RES]
R114  100R 0603  [1608[0603]RES]
R115  200R 0603  [1608[0603]RES]
R116  1K 0603  [1608[0603]RES]
R117  1K 0603  [1608[0603]RES]
R118  200R 0603  [1608[0603]RES]
R119  200R 0603  [1608[0603]RES]
R120  200R 0603  [1608[0603]RES]
R121  1K 0603  [1608[0603]RES]
R122  100R 0603  [1608[0603]RES]
R123  200R 0603  [1608[0603]RES]
R124  1K 0603  [1608[0603]RES]
R125  100R 0603  [1608[0603]RES]
R126  200R 0603  [1608[0603]RES]
R127  10R 0603  [1608[0603]RES]
R128  100R 0603  [1608[0603]RES]
R129  10R 0603  [1608[0603]RES]
R130  10R 0603  [1608[0603]RES]
R131  100R 0603  [1608[0603]RES]
R132  10R 0603  [1608[0603]RES]
R133  1K 0603  [1608[0603]RES]
R134  10R 0603  [1608[0603]RES]
R135  499R 0603  [1608[0603]RES]
R136  499R 0603  [1608[0603]RES]
R137  499R 0603  [1608[0603]RES]
R138  5R 0603  [1608[0603]RES]
R139  22R 0603  [1608[0603]RES]
R140  1.78K  [1005[0402]RES]
R141  2.8K  [1005[0402]RES]
R142  1K  [1005[0402]RES]
R143  1K  [1005[0402]RES]
R144  5R 0603  [1608[0603]RES]
R145  22R 0603  [1608[0603]RES]
R146  499R 0603  [1608[0603]RES]
R147  499R 0603  [1608[0603]RES]
R148  499R 0603  [1608[0603]RES]
R149  1K 0603  [1608[0603]RES]
R150  33R  [1005[0402]RES]
R151  33R  [1005[0402]RES]
R152  33R  [1005[0402]RES]
R153  33R  [1005[0402]RES]
R154  1.27K  [1005[0402]RES]
R155  1.3K  [1005[0402]RES]
R156  33R  [1005[0402]RES]
R157  33R  [1005[0402]RES]
R158  1K  [1005[0402]RES]
R159  1K  [1005[0402]RES]
R160  33R  [1005[0402]RES]
R161  33R  [1005[0402]RES]
R162  0.047R 0603  [1608[0603]RES]
R163  120K 0603  [1608[0603]RES]
R164  0R 0603  [1608[0603]RES]
TP17  TP_P  [tpad_020_REC]  (value not drawn)
TP18  TP_P  [tpad_020_REC]  (value not drawn)
TP19  TP_P  [tpad_020_REC]  (value not drawn)
TP20  TP_P  [tpad_020_REC]  (value not drawn)
TP21  TP_P  [tpad_020_REC]  (value not drawn)
TP22  TP_P  [tpad_020_REC]  (value not drawn)
TP23  TP_P  [tpad_020_REC]  (value not drawn)
TP24  TP_P  [tpad_020_REC]  (value not drawn)
TP25  TP_P  [tpad_020_REC]  (value not drawn)
TP26  TP_P  [tpad_020_REC]  (value not drawn)
TP27  TP_P  [tpad_020_REC]  (value not drawn)
TP28  TP_P  [tpad_020_REC]  (value not drawn)
TP29  TP_P  [tpad_020_REC]  (value not drawn)
TP30  TP_P  [tpad_020_REC]  (value not drawn)
TP31  TP_P  [tpad_020_REC]  (value not drawn)
TP32  TP_P  [tpad_020_REC]  (value not drawn)
TP33  TP_P  [tpad_020_REC]  (value not drawn)
TP34  TP_N  [tpad_020]  (value not drawn)
TP35  TP_N  [tpad_020]  (value not drawn)
TP36  TP_N  [tpad_020]  (value not drawn)
TP37  TP_P  [tpad_020_REC]  (value not drawn)
TP38  TP_P  [tpad_020_REC]  (value not drawn)
TP39  TP_P  [tpad_020_REC]  (value not drawn)
TP40  TP_P  [tpad_020_REC]  (value not drawn)
TP41  TP_P  [tpad_020_REC]  (value not drawn)
TP42  TP_P  [tpad_020_REC]  (value not drawn)
TP43  TP_P  [tpad_020_REC]  (value not drawn)
TP44  TP_P  [tpad_020_REC]  (value not drawn)
TP45  TP_P  [tpad_020_REC]  (value not drawn)
TP46  TP_P  [tpad_020_REC]  (value not drawn)
TP47  TP_P  [tpad_020_REC]  (value not drawn)
TP48  TP_P  [tpad_020_REC]  (value not drawn)
TP49  TP_P  [tpad_020_REC]  (value not drawn)
TP50  TP_P  [tpad_020_REC]  (value not drawn)
TP51  TP_N  [tpad_020]  (value not drawn)
TP52  TP_N  [tpad_020]  (value not drawn)
TP53  TP_N  [tpad_020]  (value not drawn)
TP54  TP_P  [tpad_020_REC]  (value not drawn)
TP55  TP_P  [tpad_020_REC]  (value not drawn)
TP56  TP_P  [tpad_020_REC]  (value not drawn)
TP57  TP_P  [tpad_020_REC]  (value not drawn)
TP58  TP_N  [tpad_020]  (value not drawn)
TP59  TP_N  [tpad_020]  (value not drawn)
TP60  TP_N  [tpad_020]  (value not drawn)
TP61  TP_P  [tpad_020_REC]  (value not drawn)
TP62  TP_P  [tpad_020_REC]  (value not drawn)
TP63  TP_P  [tpad_020_REC]  (value not drawn)
TP64  TP_P  [tpad_020_REC]  (value not drawn)
TP65  TP_P  [tpad_020_REC]  (value not drawn)
TP66  TP_P  [tpad_020_REC]  (value not drawn)
TP67  TP_N  [tpad_020]  (value not drawn)
TP68  TP_N  [tpad_020]  (value not drawn)
TP69  TP_N  [tpad_020]  (value not drawn)
TP70  TP_N  [tpad_020]  (value not drawn)
TP73  TP_N  [tpad_020]  (value not drawn)
U9  DAC904E  [TSSOP28]
U10  TMUX1108PWR  [TSSOP16]
U11  OPA810IDBVR  [SOT23-5]
U12  OPA810IDBVR  [SOT23-5]
U13  OPA810IDBVR  [SOT23-5]
U14  TMUX1108PWR  [TSSOP16]
U15  OPA320AIDBVR  [SOT23-5]
U16  OPA320AIDBVR  [SOT23-5]
U17  OPA320AIDBVR  [SOT23-5]
U18  OPA320AIDBVR  [SOT23-5]
U19  TPS7A4901DGN  [HVSSOP8]
U20  TPS7A4901DGN  [HVSSOP8]
U21  ADS127L21IRUK  [WQFN20]
U22  THS4551IDGK  [VSSOP8]
U23  TPS7A4901DGN  [HVSSOP8]
U24  TPS7A3001DGN  [HVSSOP8]
U25  REF6025IDGK  [VSSOP8]

### Nets
1V8: C215.1 C216.1 U21.13(IOVDD)
3V3: C142.2 C144.1 U9.27(+VD)
5V: C194.1 C195.2 C198.1 C199.2 C219.1 C220.2 U19.5(EN) U19.8(IN) U20.5(EN) U20.8(IN) U23.5(EN) U23.8(IN)
+A2V7: C221.2 C222.1 C227.2 R57.2 R60.1 R62.1 R63.1 R104.2 R106.1 R107.1 R108.1 R109.1 R154.2 TP61.1(A2) U23.1(OUT)
-5V: C223.1 C224.2 U24.5(EN) U24.8(IN)
-A2V7: C225.2 C226.1 C228.2 R66.2 R90.1 R93.1 R94.1 R110.2 R127.1 R129.1 R130.1 R132.1 R155.2 TP62.1(A2) U24.1(OUT)
A3V3: C141.1 C143.2 C148.1 C196.2 C197.1 C202.2 R140.2 TP54.1(A2) U9.24(+VA) U19.1(OUT)
A4V5: C200.2 C201.1 C203.2 C208.1 C209.1 C234.1 R134.1 R141.2 TP55.1(A2) U20.1(OUT) U21.19(AVDD2) U21.20(AVDD1) U25.1(VIN) U25.2(EN)
AGND: C141.2 C143.1 C145.2 C146.2 C147.1 C149.2 C150.2 C151.1 C152.1 C153.1 C154.1 C155.2 C156.1 C157.2 C159.1 C160.1 C161.1 C162.2 C163.2 C164.2 C165.2 C168.2 C169.2 C170.1 C171.2 C172.2 C173.1 C174.2 C175.1 C176.1 C177.1 C178.2 C179.1 C180.1 C181.2 C182.1 C183.1 C184.1 C185.1 C186.2 C187.1 C188.2 C189.2 C190.2 C191.2 C192.2 C193.1 C194.2 C195.1 C196.1 C197.2 C198.2 C199.1 C200.1 C201.2 C208.2 C209.2 C210.2 C211.1 C212.1 C213.2 C214.2 C217.1 C218.1 C219.2 C220.1 C221.1 C222.2 C223.2 C224.1 C225.1 C226.2 C229.2 C230.2 C231.1 C232.1 C233.2 C234.2 C235.2 P4.2(Y) P4.3(Y) P4.4(Y) P5.2(Y) P5.3(Y) P5.4(Y) R77.2 R80.1 R86.2 R87.2 R88.2 R89.2 R98.2 R113.2 R121.2 R124.2 R125.2 R131.2 R135.1 R142.1 R143.1 R158.1 R159.1 R163.1 R164.1 TP34.1(A2) TP35.1(A2) TP36.1(A2) TP51.1(A2) TP52.1(A2) TP53.1(A2) TP58.1(A2) TP59.1(A2) TP60.1(A2) TP67.1(A2) TP68.1(A2) TP70.1(A2) TP73.1(A2) U9.16(~{INT}/EXT) U9.20(AGND) U10.14(GND) U14.14(GND) U19.4(GND) U19.9(PAD) U20.4(GND) U20.9(PAD) U21.5(REFN) U21.17(AVSS) U21.21(PAD) U22.6(VS-) U23.4(GND) U23.9(PAD) U24.4(GND) U24.9(PAD) U25.7(GND_F) U25.8(GND_S)
GND: C142.1 C144.2 C215.2 C216.2 R164.2 TP69.1(A2) U9.26(DGND) U21.14(DGND)
R2V5: C213.1 C214.1 C229.1 C230.1 R162.2 TP66.1(A2) U21.4(REFP) U22.2(VCOM) U25.5(OUT_S) U25.6(OUT_F)
AD_CLK: R151.1 TP64.1(A2)
AD_CS: R160.1
AD_DRDY: R152.1 TP65.1(A2)
AD_N: C207.2 C210.1 R145.2 TP57.1(A2) U21.2(AINN)
AD_P: C193.2 C207.1 R139.2 TP56.1(A2) U21.1(AINP)
AD_RST: R161.1
AD_SCLK: R156.1
AD_SDI: R157.1
AD_SDO: R153.1
AD_START: R150.1 TP63.1(A2)
DA_CLK: R64.2 TP22.1(A2)
DA_D0: R65.2
DA_D1: R67.2
DA_D2: R68.2
DA_D3: R70.2
DA_D4: R71.2
DA_D5: R75.2
DA_D6: R78.2
DA_D7: R81.2
DA_D8: R84.2
DA_D9: R91.2
DA_D10: R95.2
DA_D11: R97.2
DA_D12: R99.2
DA_D13: R100.2
DA_N: C158.2 R74.1 R88.1 TP32.1(A2) U9.21(I~{OUT})
DA_P: C158.1 R69.1 R89.1 TP33.1(A2) U9.22(IOUT)
DA_PD: R61.2
RX_AMP: R105.1 R146.1 TP48.1(A2) U17.1(OUT_A)
RX_Div1: R102.1 R111.2 R115.1 TP41.1(A2) U14.4(S1) U15.1(OUT_A)
RX_Div1F: C167.2 R103.1 R120.1 TP46.1(A2) U14.12(S5) U18.1(OUT_A)
RX_Div2: R118.1 R119.1 TP42.1(A2) U14.5(S2)
RX_Div2F: R123.1 R126.1 TP47.1(A2) U14.11(S6)
RX_Div4: R119.2 R122.2 TP43.1(A2) U14.6(S3)
RX_Div4F: R126.2 R128.2 TP49.1(A2) U14.10(S7)
RX_Div8: R122.1 R125.1 TP44.1(A2) U14.7(S4)
RX_Div8F: R128.1 R131.1 TP50.1(A2) U14.9(S8)
RX_IN: P5.1(X) R114.2 TP45.1(A2)
RX_MUX_A0: TP38.1(A2) U14.1(A0)
RX_MUX_A1: TP39.1(A2) U14.16(A1)
RX_MUX_A2: TP40.1(A2) U14.15(A2)
RX_MUX_EN: TP37.1(A2) U14.2(EN)
RX_MUX_OUT: TP26.1(A2) U14.8(D) U17.3(IN+)
TX_Div1: R58.1 R72.2 R82.1 TP21.1(A2) U10.4(S1) U12.1(OUT_A)
TX_Div1F: R56.1 R73.1 TP28.1(A2) U10.12(S5) U11.1(OUT_A)
TX_Div2: R85.1 R92.1 TP23.1(A2) U10.5(S2)
TX_Div2F: R76.1 R79.1 TP29.1(A2) U10.11(S6)
TX_Div4: R92.2 R96.2 TP24.1(A2) U10.6(S3)
TX_Div4F: R79.2 R83.2 TP30.1(A2) U10.10(S7)
TX_Div8: R96.1 R98.1 TP25.1(A2) U10.7(S4)
TX_Div8F: R83.1 R86.1 TP31.1(A2) U10.9(S8)
TX_MUX_A0: TP18.1(A2) U10.1(A0)
TX_MUX_A1: TP19.1(A2) U10.16(A1)
TX_MUX_A2: TP20.1(A2) U10.15(A2)
TX_MUX_EN: TP17.1(A2) U10.2(EN)
TX_MUX_OUT: U10.8(D) U13.3(IN+)
TX_OUT: P4.1(X) R59.1 R77.1 U13.1(OUT_A)
NetC145_1: C145.1 C151.2 R60.2 U11.5(V+)
NetC146_1: C146.1 C147.2 R57.1 U10.13(VDD)
NetC148_2: C148.2 U9.19(BW)
NetC149_1: C149.1 C153.2 R62.2 U12.5(V+)
NetC150_1: C150.1 C156.2 R63.2 U13.5(V+)
NetC152_2: C152.2 U9.23(BYP)
NetC154_2: C154.2 C155.1 R66.1 U10.3(VSS)
NetC157_1: C157.1 R72.1 TP27.1(A2) U11.3(IN+)
NetC159_2: C159.2 C162.1 R90.2 U11.2(V-)
NetC160_2: C160.2 C164.1 R93.2 U12.2(V-)
NetC161_2: C161.2 C165.1 R94.2 U13.2(V-)
NetC163_1: C163.1 U9.17(REFin)
NetC166_1: C166.1 R112.1 U16.4(IN-)
NetC166_2: C166.2 R101.1 R116.2 U16.1(OUT_A)
NetC167_1: C167.1 R117.1 U18.4(IN-)
NetC168_1: C168.1 C173.2 R106.2 U15.5(V+)
NetC169_1: C169.1 C170.2 R104.1 U14.13(VDD)
NetC171_1: C171.1 C175.2 R108.2 U17.5(V+)
NetC172_1: C172.1 C176.2 R107.2 U16.5(V+)
NetC174_1: C174.1 C179.2 R109.2 U18.5(V+)
NetC177_2: C177.2 C178.1 R110.1 U14.3(VSS)
NetC180_2: C180.2 R101.2 R111.1 R112.2
NetC181_1: C181.1 R114.1 U15.3(IN+)
NetC182_2: C182.2 R103.2 R116.1 R117.2
NetC183_2: C183.2 C186.1 R127.2 U15.2(V-)
NetC184_2: C184.2 C188.1 R130.2 U17.2(V-)
NetC185_2: C185.2 C189.1 R129.2 U16.2(V-)
NetC187_2: C187.2 C190.1 R132.2 U18.2(V-)
NetC191_1: C191.1 C192.1 R134.2 U22.3(VS+) U22.7(PDZ)
NetC202_1: C202.1 R140.1 R142.2 U19.2(FB)
NetC203_1: C203.1 R141.1 R143.2 U20.2(FB)
NetC204_1: C204.1 R135.2 R136.1
NetC204_2: C204.2 R146.2 R147.1
NetC205_1: C205.1 R133.1 R136.2 R137.1
NetC205_2: C205.2 R147.2 R148.1 R149.1
NetC206_1: C206.1 R137.2 U22.1(IN-)
NetC206_2: C206.2 R148.2 U22.8(IN+)
NetC211_2: C211.2 U19.6(NR/SS)
NetC212_2: C212.2 U20.6(NR/SS)
NetC217_2: C217.2 U21.18(CAPA)
NetC218_2: C218.2 U21.15(CAPD)
NetC227_1: C227.1 R154.1 R158.2 U23.2(FB)
NetC228_1: C228.1 R155.1 R159.2 U24.2(FB)
NetC231_2: C231.2 U23.6(NR/SS)
NetC232_2: C232.2 U24.6(NR/SS)
NetC233_1: C233.1 R162.1
NetC235_1: C235.1 U25.4(FILT)
NetR56_2: R56.2 U11.4(IN-)
NetR58_2: R58.2 R69.2 U12.4(IN-)
NetR59_2: R59.2 U13.4(IN-)
NetR61_1: R61.1 U9.15(PD)
NetR64_1: R64.1 U9.28(CLK)
NetR65_1: R65.1 U9.14(D0)
NetR67_1: R67.1 U9.13(D1)
NetR68_1: R68.1 U9.12(D2)
NetR70_1: R70.1 U9.11(D3)
NetR71_1: R71.1 U9.10(D4)
NetR73_2: R73.2 R76.2
NetR74_2: R74.2 R80.2 U12.3(IN+)
NetR75_1: R75.1 U9.9(D5)
NetR78_1: R78.1 U9.8(D6)
NetR81_1: R81.1 U9.7(D7)
NetR82_2: R82.2 R85.2
NetR84_1: R84.1 U9.6(D8)
NetR87_1: R87.1 U9.18(FSA)
NetR91_1: R91.1 U9.5(D9)
NetR95_1: R95.1 U9.4(D10)
NetR97_1: R97.1 U9.3(D11)
NetR99_1: R99.1 U9.2(D12)
NetR100_1: R100.1 U9.1(D13)
NetR102_2: R102.2 U15.4(IN-)
NetR105_2: R105.2 R113.1 U17.4(IN-)
NetR115_2: R115.2 R118.2
NetR120_2: R120.2 R123.2
NetR121_1: R121.1 U16.3(IN+)
NetR124_1: R124.1 U18.3(IN+)
NetR133_2: R133.2 R138.2 R139.1
NetR138_1: R138.1 U22.4(OUT+)
NetR144_1: R144.1 U22.5(OUT-)
NetR144_2: R144.2 R145.1 R149.2
NetR150_2: R150.2 U21.16(START)
NetR151_2: R151.2 U21.12(CLK)
NetR152_2: R152.2 U21.11(~{DRDY})
NetR153_2: R153.2 U21.10(SDO)
NetR156_2: R156.2 U21.9(SCLK)
NetR157_2: R157.2 U21.8(SDI)
NetR160_2: R160.2 U21.7(~{CS})
NetR161_2: R161.2 U21.6(~{RST})
NetR163_2: R163.2 U25.3(SS)

Not connected (* = marked no-connect by the designer): U9 25(NC)*; U19 3(NC)* 7(DNC)*; U20 3(NC)* 7(DNC)*; U21 3(VCM)*; U23 3(NC)* 7(DNC)*; U24 3(NC)* 7(DNC)*

### Layout directives
net class DA_DATA: DA_CLK, DA_D0, DA_D1, DA_D2, DA_D3, DA_D4, DA_D5, DA_D6, DA_D7, DA_D8, DA_D9, DA_D10, DA_D11, DA_D12, DA_D13, DA_PD

### Notes on the sheet
- TX
- (near U9) DAC
- 内部参考电压Vref = 1.24V
- FS电流 Ifs = Vref / Rset * 32 = 1.24 / 2k * 32 = 19.84mA
- OPA810 的带宽达到70M，足以应对几M的HF
- (near R56) 发射端还是更多考虑带宽，要有足够的频响冗余保证相位的精度
- 导通电阻Typ. 4Ohm
- 供电电压压着5.5V上限，这样还能保证运放可以有5V摆幅
- (near R58) Rload = 25Ohm, Vload(pp) = 0.01984 * 25 = 0.496V
- Amp Gain = 2.01
- Vout 范围约为±1V
- (near R58) Ifs = Iout(p) + Iout(n)
- 所有运放用单运放避免串扰
- 电源脚加低通
- A0/A1选择衰减，A2选择滤波
- 100% = ±1V 对地
- (near P4) 最大±1V 对地
- (near R87) Rset
- 精密多路复用，在不同衰减以及滤波中选择
- (near U9) DAC904E: 14Bit, 165M
- 负载电阻，将电流换成电压
- 单电源差分转双电源单端
- 无滤波衰减
- (near R90) tao = 100ns, 10MHz
- 阻抗变换
- 有滤波衰减
- 信号选择
- (near R94) 出去之前阻抗变换一下
- 假负载，没上电时起下拉作用
- 注意是TSSOP28封装不是SO28
- 放大20倍（略小至19.7防CLIP）
- RX
- 选滤波时，只要进来信号不到2.7V，
- (near R102) RX采用OPA320，带宽比OPA810低，但是轨至轨，偏置小
- 1V的信号进来，用DIV8，再乘20, 刚好正负2.5V摆幅
- (near R105) 如果滤波了1V会变小，视情况选衰减
- (near R105) 如果信号小，视情况选衰减
- 滤完不超过1V就没有关系。
- 不选滤波时，超过1V后面放大会CLIP
- 如果不衰减，1/8V对应满量程
- fk = 15kHz, ζ = 0.7
- @5KHz: -42mdB
- @10KHz: -1.53dB
- @40KHz: -35.58dB
- 如果改HF频率，RC要重新算
- (near TP48) 最大±2.7V 对地(Clip)
- MAX ±1V/±2.7V 对地
- 与TX一样，用MUX做衰减和滤波的选择
- 4阶低通滤波器
- 信号放大
- 单端转差分
- (near U21) ADC
- 单端转差分，把电压抬上来
- 同时也是防混叠滤波器
- -0.1dB @ 260kHz
- +3V3/150mA 超低噪音模拟电源, DA专用
- +4V5/150mA 超低噪音模拟电源, DA专用
- -3dB @ 550kHz
- 即使用2M的HF，带宽也是足够的
- 24Bit Sigma-Delta ADC
- 因为希望做到最快速度，所以AVDD要>=4.5V
- 虽然AD可以工作在双电源，但为了避免风险，还是继续单电源
- +2V7/150mA 超低噪音模拟电源, 运放、模拟开关用
- -2V7/200mA 超低噪音模拟电源, 运放、模拟开关用
- US MIMO Test Bench - Analog
- (near U25) AD参考电压/差分共模电压
- (near R164) 在模拟电源附近接地
- PS-25-001-E-01
- 1
- 3
- A0
- W.D.
- (in symbol LM7321MF) +; _
- (in symbol THS4551) V+; V-
- (in symbol TPS7A3001DGN) Vfb = -1.176V
- (in symbol TPS7A4901DGN) Vfb = 1.185V

### Library data of the parts
C141-C235 = Cap: Capacitor; Published: 8-Jun-2000; LatestRevisionDate: 17-Jul-2002; LatestRevisionNote: Re-released for DXP Platform.; PackageReference: RAD-0.3; Publisher: Altium Limited; PackageDescription: Radial Cap, Thru-Hole; 2 Leads; 0.3 in Pin Spacing
P4 P5 = BNC_TE: BNC Elbow Connector; LatestRevisionDate: 17-Jul-2002; LatestRevisionNote: Re-released for DXP Platform.; Publisher: Altium Limited
R56-R164 = Res1: Resistor; Published: 8-Jun-2000; LatestRevisionDate: 17-Jul-2002; LatestRevisionNote: Re-released for DXP Platform.; PackageReference: AXIAL-0.3; Publisher: Altium Limited; PackageDescription: Axial Device, Thru-Hole; 2 Leads; 0.3 in Pin Spacing
U11-U13 U15-U18 = LM7321MF: Op Amp
U21 = ADS127L21
U22 = THS4551
U25 = REF60xx